# Altium schematic sheet 1原理图-早期版本(2021-05-12).SchDoc
size A3
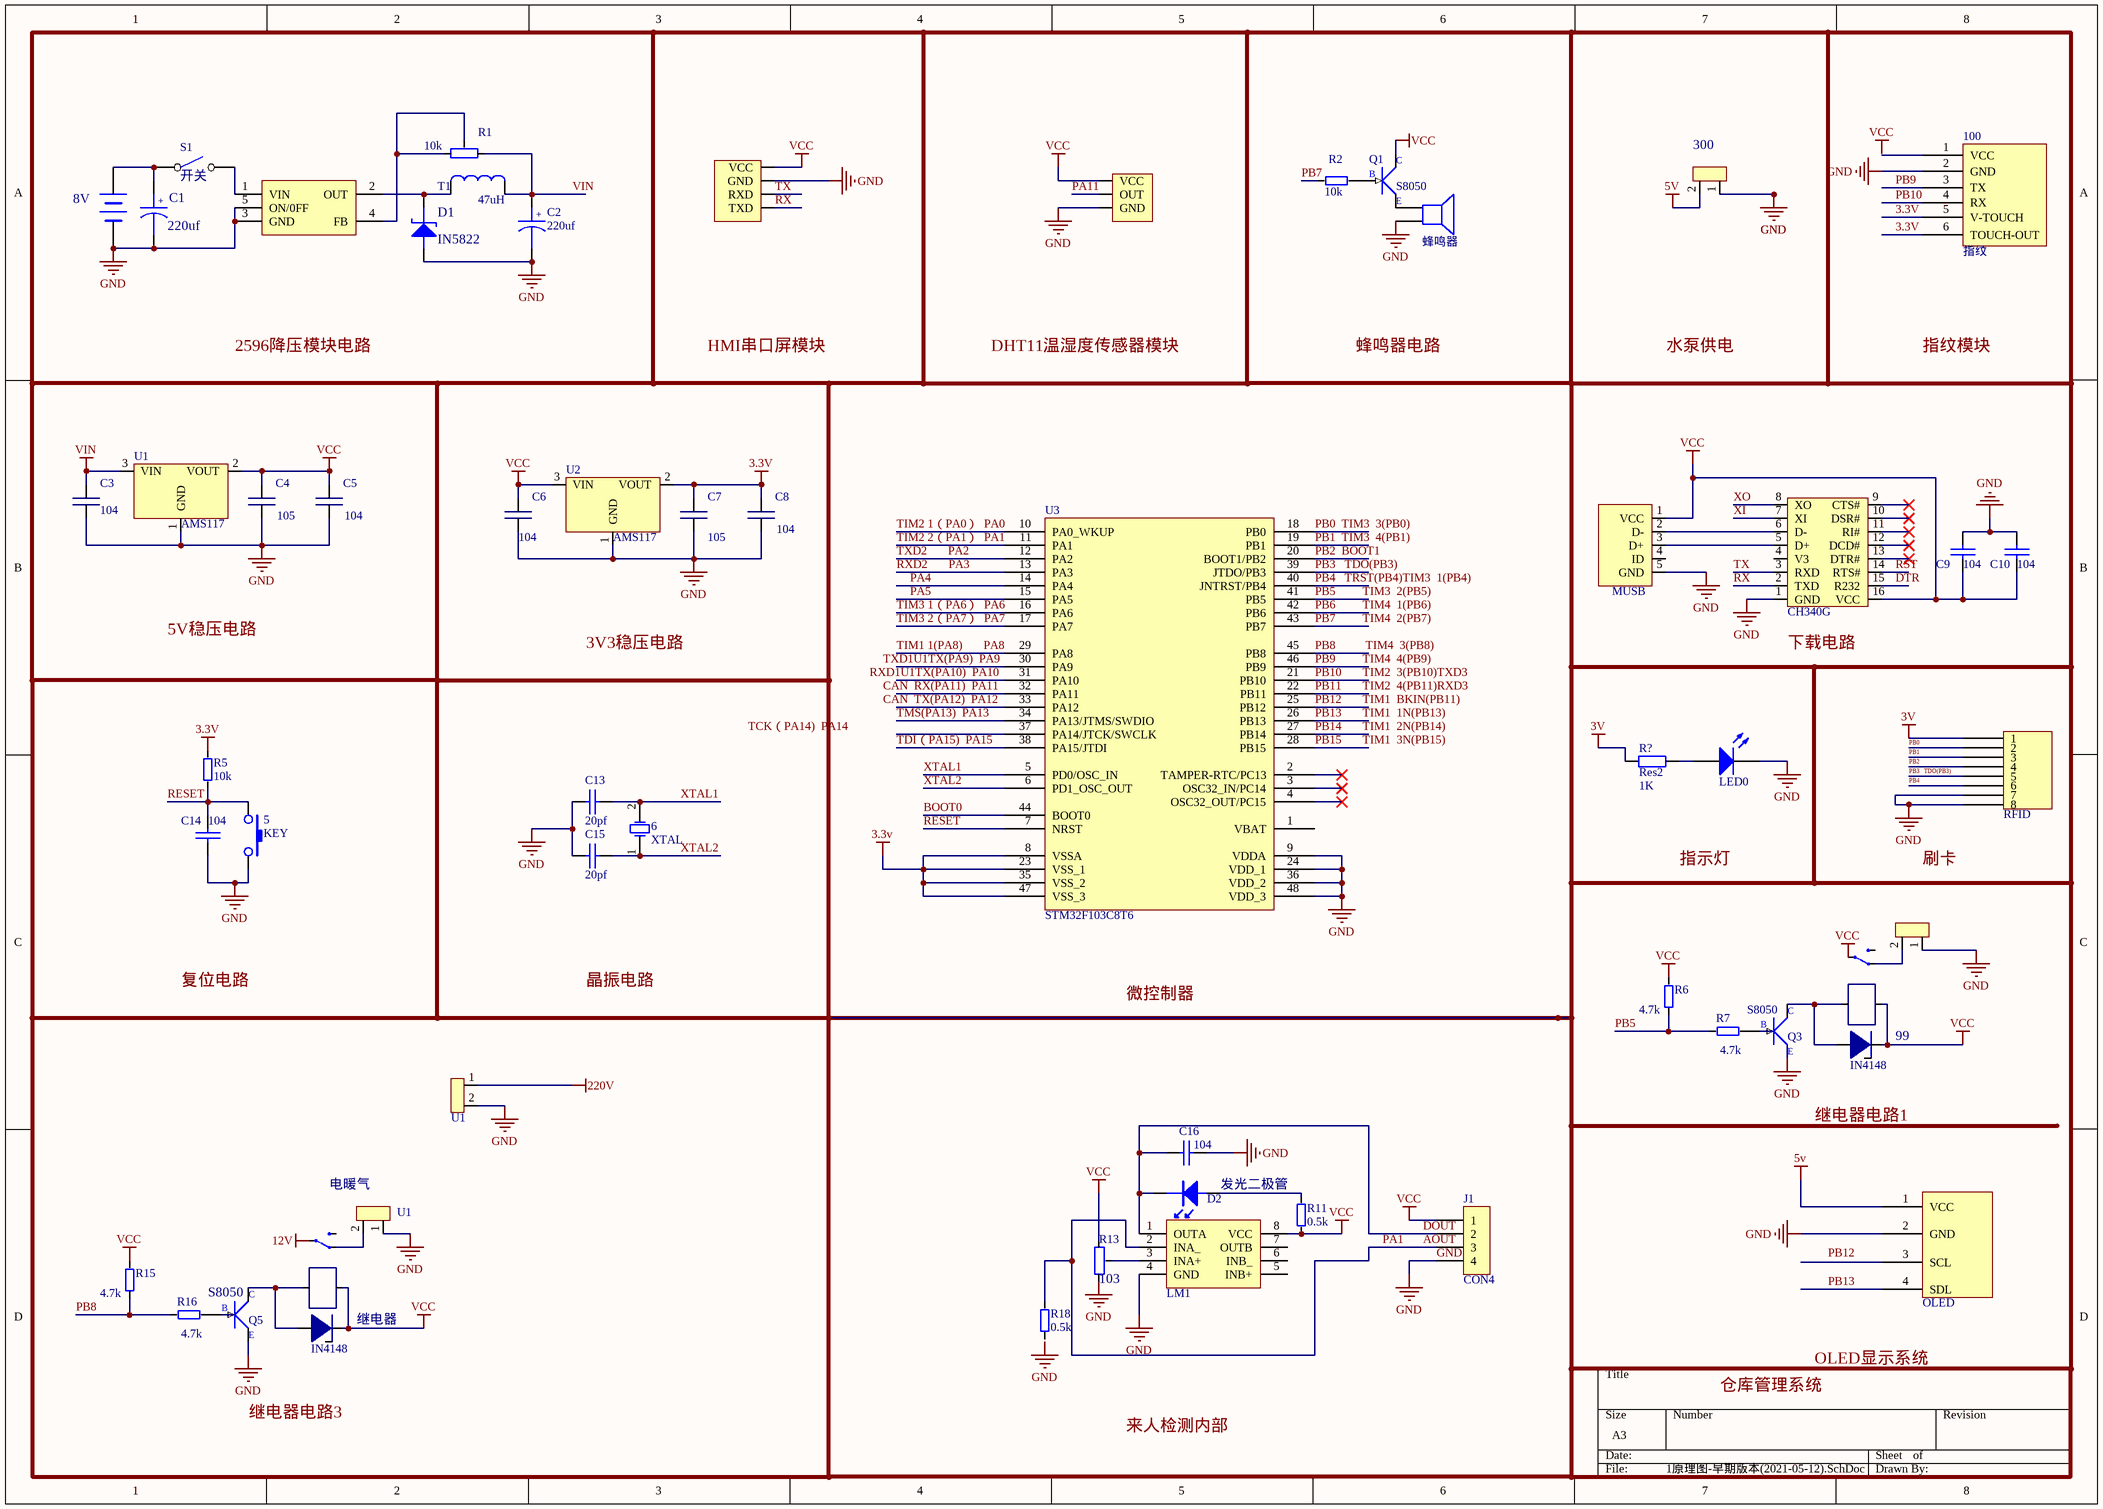
[diagram p0: 1原理图-早期版本(2021-05-12).SchDoc]

## Parts
1  2596降压模块  [8-8LED点阵 - duplicate]  (value not drawn)
5  KEY
6  XTAL  [XTAL]
8V  BATTERY  (value not drawn)
60  U1
99  继电器  (value not drawn)
100  指纹
300  CON2  (value not drawn)
800  CON2  (value not drawn)
*  RFID
*1  CON2_1  (value not drawn)
*3  hc12  (value not drawn)
*5  CH340G
*6  MUSB
*7  IN4148  [0805_LED_1]
*13  IN4148  [0805_LED_1]
?  OLED
C1  220uf
C2  220uf
C3  104  [0805-RES-CAP]
C4  105  [0805-RES-CAP]
C5  104  [0805-RES-CAP]
C6  104  [0805-RES-CAP]
C7  105  [0805-RES-CAP]
C8  104  [0805-RES-CAP]
C9  104  [RAD0.1]
C10  104  [RAD0.1]
C13  20pf  [RAD0.1]
C14  104  [RAD0.1]
C15  20pf  [RAD0.1]
C16  104  [RAD0.1]
D1  IN5822
D2  发光二极管  [LED3毫米]
D?  LED0  [LED-0]
J1  CON4
LM1  火焰传感器  (value not drawn)
Q1  S8050
Q3  S8050
Q5  S8050
R1  10k  [VR]
R2  10k  [R标准]
R5  10k  [R标准]
R6  4.7k  [R标准]
R7  4.7k  [R标准]
R11  0.5k  [R标准]
R13  103  [VR]
R15  4.7k  [R标准]
R16  4.7k  [R标准]
R18  0.5k  [R标准]
R?  Res2  value 1K  [AXIAL-0.4]
S1  开关
T1  47uH
U1  AMS117  [SOT-223]
U2  AMS117  [SOT-223]
U3  STM32F103C8T6
电暖气  U1
继电器  继电器  (value not drawn)
蜂鸣器1  蜂鸣器

## Nets
3.3V: 100.5(V-TOUCH) 100.6(TOUCH-OUT) C7.2 C8.2 R5.2 U2.2(VOUT) U3.8(VSSA) U3.23(VSS_1) U3.35(VSS_2) U3.47(VSS_3)
3V: *.15(1) R?.1
5V: 300.2 ?.1(VCC)
12V: 继电器.1
220V: 60.1
GND: 1.3(GND) 1.5(ON/0FF) 5.2 8V.2(-) 60.2 100.2(GND) 300.1 800.1 *.21(7) *.22(8) *1.3(GND) *3.1(GND) *5.1(GND) *6.5(GND) ?.2(GND) C1.2 C2.2 C3.1 C4.1 C5.1 C6.1 C7.1 C8.1 C9.1 C10.1 C13.1 C14.2 C15.2 C16.2 D1.1(A) D?.2(K) J1.4 LM1.4(GND) Q3.3 R13.1 U1.1(GND) U2.1(GND) U3.9(VDDA) U3.24(VDD_1) U3.36(VDD_2) U3.48(VDD_3) 电暖气.1 蜂鸣器1.2
VCC: 99.1 *1.1(VCC) *3.1(VCC) *5.16(VCC) *6.1(VCC) *7.2 *13.2 C4.2 C5.2 C6.2 C9.2 C10.2 J1.1 LM1.8(VCC) Q1.2 R6.2 R11.1 R13.2 R15.2 U1.2(VOUT) U2.3(VIN) 继电器.1
VIN: C2.1 C3.2 R1.1 T1.3 U1.3(VIN)
AOUT: J1.3 LM1.2(INA_) R18.2  [also labelled PA1]
BOOT0: U3.44(BOOT0)
DOUT: C16.1 D2.2 J1.2 LM1.1(OUTA)
DTR: *5.15(R232)
PA4: U3.14(PA4)
PA5: U3.15(PA5)
PA11: *1.2(OUT)
PB0: *.16(2)
PB0  TIM3  3(PB0): U3.18(PB0)
PB1: *.17(3)
PB1  TIM3  4(PB1): U3.19(PB1)
PB2: *.18(4)
PB2  BOOT1: U3.20(BOOT1/PB2)
PB3   TDO(PB3): *.19(5) U3.39(JTDO/PB3)
PB4: *.20(6)
PB4   TRST(PB4)TIM3  1(PB4): U3.40(JNTRST/PB4)
PB5: R6.1 R7.1
PB5         TIM3  2(PB5): U3.41(PB5)
PB6         TIM4  1(PB6): U3.42(PB6)
PB7: R2.1
PB7         TIM4  2(PB7): U3.43(PB7)
PB8: R15.1 R16.1
PB8          TIM4  3(PB8): U3.45(PB8)
PB9: 100.3(TX)
PB9         TIM4  4(PB9): U3.46(PB9)
PB10: 100.4(RX)
PB10       TIM2  3(PB10)TXD3: U3.21(PB10)
PB11       TIM2  4(PB11)RXD3: U3.22(PB11)
PB12       TIM1  BKIN(PB11): U3.25(PB12)
PB13: ?.4(SDL)
PB13       TIM1  1N(PB13): U3.26(PB13)
PB14       TIM1  2N(PB14): U3.27(PB14)
PB15       TIM1  3N(PB15): U3.28(PB15)
RESET: 5.1 C14.1 R5.1 U3.7(NRST)
RST: *5.14(RTS#)
RX: *3.3(TXD) *5.2(TXD)
RXD2       PA3: U3.13(PA3)
TDI（PA15)  PA15: U3.38(PA15/JTDI)
TIM1 1(PA8)       PA8: U3.29(PA8)
TIM2 1（PA0）  PA0: U3.10(PA0_WKUP)
TIM2 2（PA1）  PA1: U3.11(PA1)
TIM3 1（PA6）  PA6: U3.16(PA6)
TIM3 2（PA7）  PA7: U3.17(PA7)
TMS(PA13)  PA13: U3.34(PA13/JTMS/SWDIO)
TX: *3.2(RXD) *5.3(RXD)
TXD2       PA2: U3.12(PA2)
XI: *5.7(XI)
XO: *5.8(XO)
XTAL1: 6.2 C13.2 U3.5(PD0/OSC_IN)
XTAL2: 6.1 C15.1 U3.6(PD1_OSC_OUT)
Net1_1: 1.1(VIN) S1.2
Net1_2: 1.2(OUT) D1.2(K) T1.1
Net1_4: 1.4(FB) R1.2 R1.3
Net8V_1: 8V.1(+) C1.1 S1.1
Net99_1: 99.1 *7.1 Q3.2
Net99_1: 99.1 800.2  [a separate net that carries the same name]
Net*5_5: *5.5(D+) *6.3(D+)
Net*5_6: *5.6(D-) *6.2(D-)
Net*13_1: *13.1 Q5.2 继电器.1
NetD2_1: D2.1 R11.2
NetD?_1: D?.1(A) R?.2
NetLM1_3: LM1.3(INA+) R13.3
NetQ1_1: Q1.1(G) R2.2
NetQ3_1: Q3.1(G) R7.2
NetQ5_1: Q5.1(G) R16.2
Net电暖气_2: 电暖气.2 继电器.1

Not connected (* = marked no-connect by the designer): 100 1(VCC); *5 4(V3) 9(CTS#)* 10(DSR#)* 11(RI#)* 12(DCD#)* 13(DTR#)*; *6 4(ID); ? 3(SCL); LM1 5(INB+) 6(INB_) 7(OUTB); Q1 3; Q5 3; R18 1; U3 1(VBAT) 2(TAMPER-RTC/PC13)* 3(OSC32_IN/PC14)* 4(OSC32_OUT/PC15)* 30(PA9) 31(PA10) 32(PA11) 33(PA12) 37(PA14/JTCK/SWCLK); 蜂鸣器1 1

## Notes on the sheet
- Labels drawn without touching a wire or pin: 3V3稳压电路, 5V稳压电路, 2596降压模块电路, CAN  RX(PA11)  PA11, CAN  TX(PA12)  PA12, DHT11温湿度传感器模块, GND, HMI串口屏模块, PB12, RXD1U1TX(PA10)  PA10, TCK（PA14)  PA14, TXD1U1TX(PA9)  PA9, VCC, 下载电路, 仓库管理系统, 刷卡, 复位电路, 微控制器, 指示灯, 指纹模块, 晶振电路, 来人检测内部, 水泵供电, 继电器电路3, 蜂鸣器电路
- (in symbol S8050) C; B; E
- (in symbol 电解电容) +

## Library data of the parts
1 = 2596降压模块: 8-8: RAD
6 = XTAL: XTAL: 12MHZ
60 电暖气 = CON2
*6 = CON4
*7 *13 = LED
? = 四个引脚口
C1 C2 = 电解电容: Capacitor
C3-C8 = CAP
C9 C10 C13-C16 = 普通电容: Capacitor
D1 = ZENER2: Zener Diode
D? = LED0: Typical INFRARED GaAs LED; Published: 8-Jun-2000; LatestRevisionDate: 08-Jul-2005; LatestRevisionNote: Mech Layer 1 removed.; PackageReference: LED-0; Publisher: Altium Limited; PackageDescription: LED; 2 Leads
J1 = CON4: Connector
LM1 = LM393: Connector
R1 R13 = 可调电阻: Potentiometer
R2 R5-R7 R11 R15 R16 R18 = RES
R? = Res2: Resistor; Published: 8-Jun-2000; LatestRevisionDate: 17-Jul-2002; LatestRevisionNote: Re-released for DXP Platform.; PackageReference: AXIAL-0.4; Publisher: Altium Limited; PackageDescription: Axial Device, Thru-Hole; 2 Leads; 0.4 in Pin Spacing
S1 = 单刀开关
T1 = TRANS3_1
U1 U2 = LM1117-3.3_1